# Altium schematic sheet Connectors.SchDoc
size B; SheetNumber: 3; SheetTotal: 8
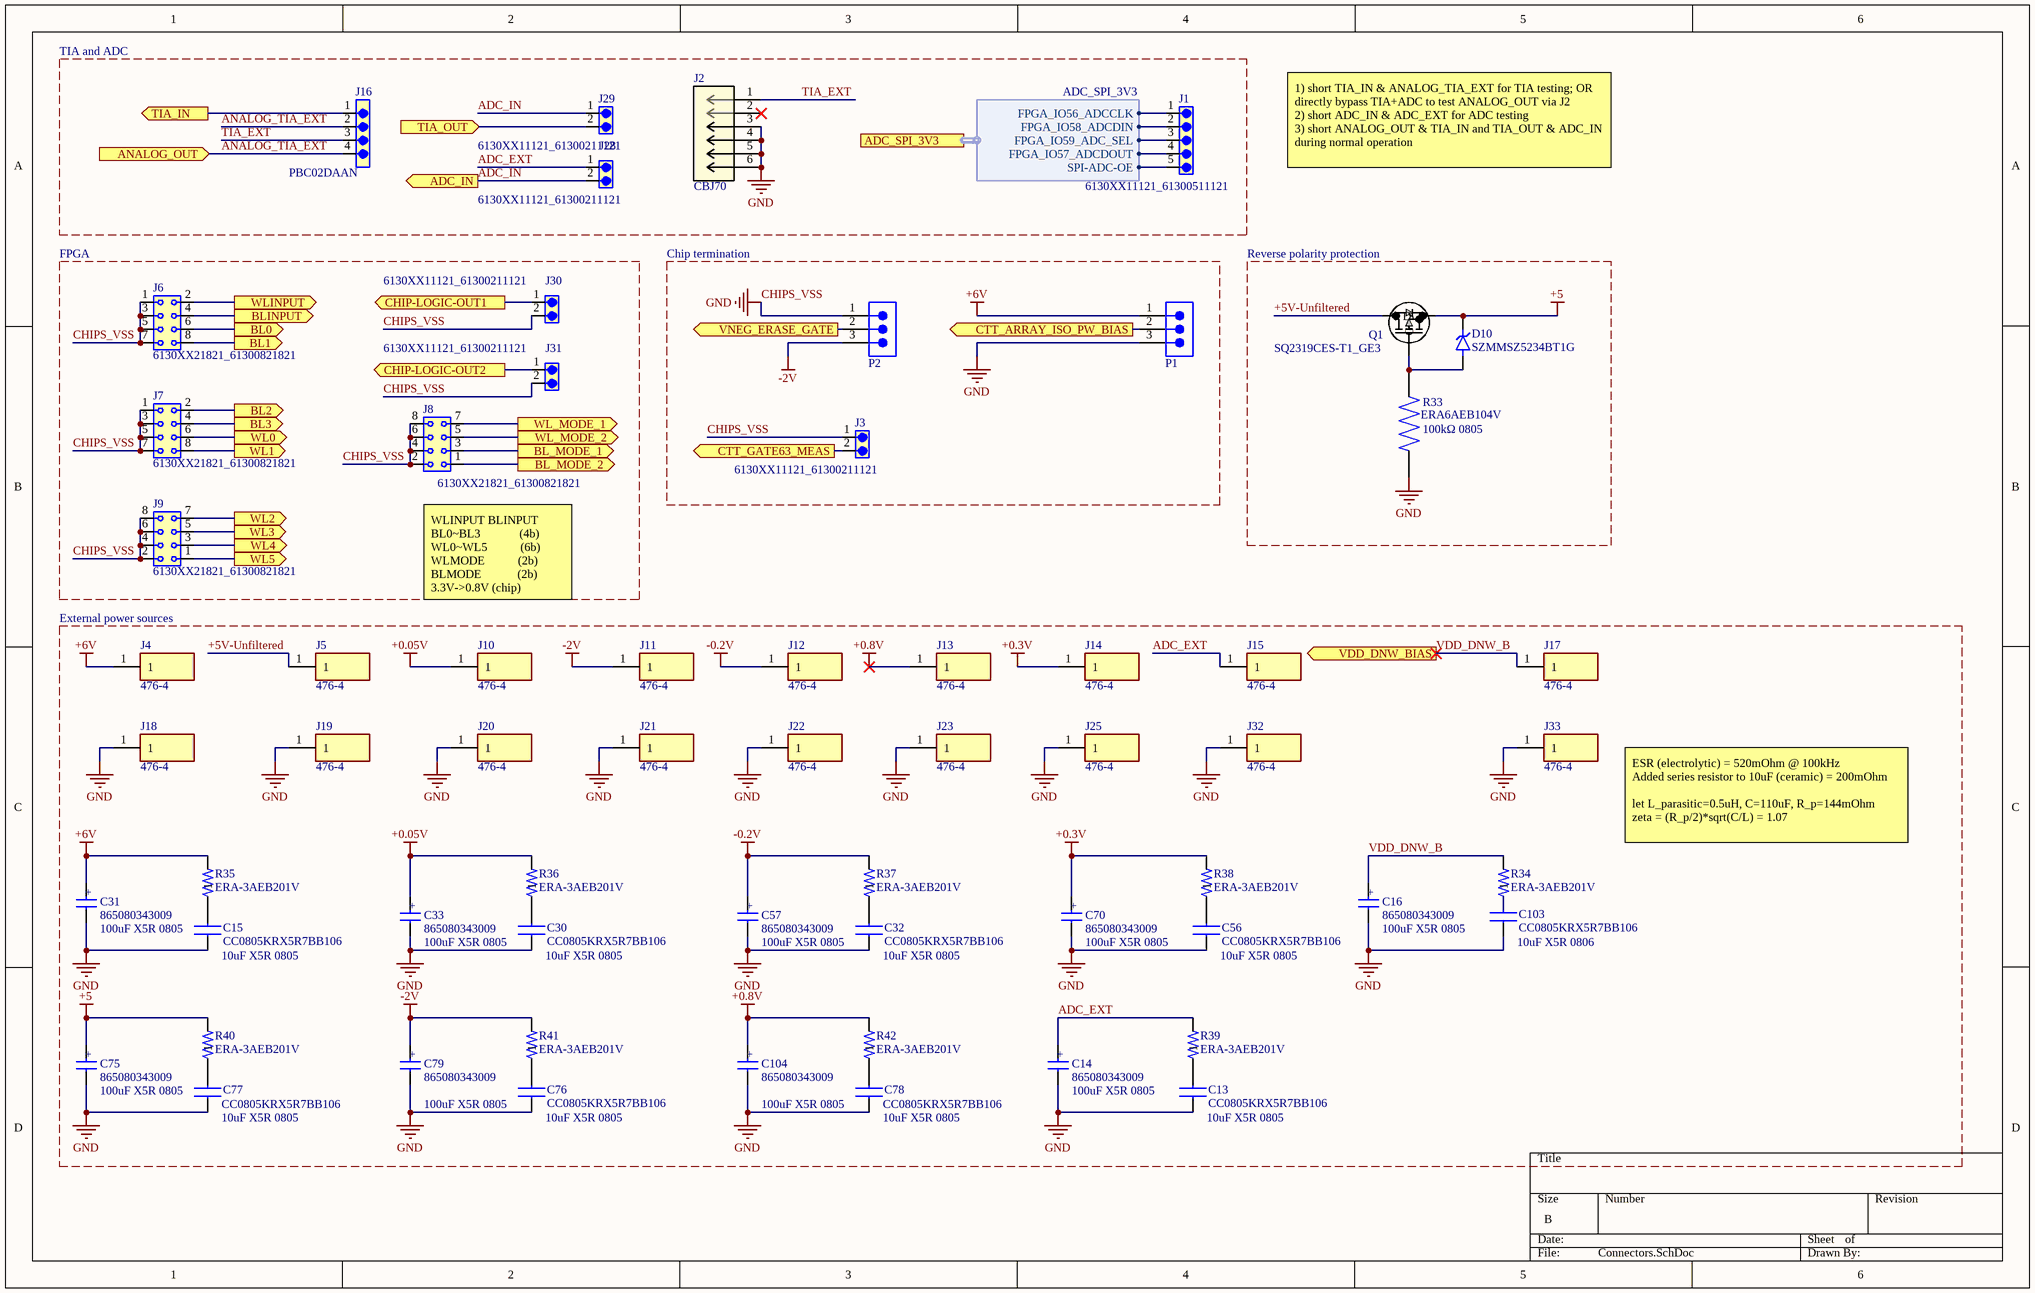
[diagram p0: Connectors.SchDoc]

## Parts
C13  CC0805KRX5R7BB106  [CAP_CC0805_YAG]
C14  865080343009  [WCAP-ASLI_6.3X5.5(DXL)]
C15  CC0805KRX5R7BB106  [CAP_CC0805_YAG]
C16  865080343009  [WCAP-ASLI_6.3X5.5(DXL)]
C30  CC0805KRX5R7BB106  [CAP_CC0805_YAG]
C31  865080343009  [WCAP-ASLI_6.3X5.5(DXL)]
C32  CC0805KRX5R7BB106  [CAP_CC0805_YAG]
C33  865080343009  [WCAP-ASLI_6.3X5.5(DXL)]
C56  CC0805KRX5R7BB106  [CAP_CC0805_YAG]
C57  865080343009  [WCAP-ASLI_6.3X5.5(DXL)]
C70  865080343009  [WCAP-ASLI_6.3X5.5(DXL)]
C75  865080343009  [WCAP-ASLI_6.3X5.5(DXL)]
C76  CC0805KRX5R7BB106  [CAP_CC0805_YAG]
C77  CC0805KRX5R7BB106  [CAP_CC0805_YAG]
C78  CC0805KRX5R7BB106  [CAP_CC0805_YAG]
C79  865080343009  [WCAP-ASLI_6.3X5.5(DXL)]
C103  CC0805KRX5R7BB106  [CAP_CC0805_YAG]
C104  865080343009  [WCAP-ASLI_6.3X5.5(DXL)]
D10  SZMMSZ5234BT1G  [DIO_SZMMSZ5234BT1G]
J1  6130XX11121_61300511121  [61300511121]
J2  CBJ70  [CONN_CBJ70_CIN]
J3  6130XX11121_61300211121  [61300211121]
J4  476-4  [4764]
J5  476-4  [4764]
J6  6130XX21821_61300821821  [61300821821]
J7  6130XX21821_61300821821  [61300821821]
J8  6130XX21821_61300821821  [61300821821]
J9  6130XX21821_61300821821  [61300821821]
J10  476-4  [4764]
J11  476-4  [4764]
J12  476-4  [4764]
J13  476-4  [4764]
J14  476-4  [4764]
J15  476-4  [4764]
J16  PBC02DAAN  [CONN4_DAAN_SUL]
J17  476-4  [4764]
J18  476-4  [4764]
J19  476-4  [4764]
J20  476-4  [4764]
J21  476-4  [4764]
J22  476-4  [4764]
J23  476-4  [4764]
J25  476-4  [4764]
J28  6130XX11121_61300211121  [61300211121]
J29  6130XX11121_61300211121  [61300211121]
J30  6130XX11121_61300211121  [61300211121]
J31  6130XX11121_61300211121  [61300211121]
J32  476-4  [4764]
J33  476-4  [4764]
P1  61300311121  [61300311121]  (value not drawn)
P2  61300311121  [61300311121]  (value not drawn)
Q1  SQ2319CES-T1_GE3  [PMOSGSD_SOT-23_TO-236_VIS]
R33  ERA6AEB104V  [RES_ERA6AEB104V]
R34  ERA-3AEB201V  [RES_ERA3AEB201V]
R35  ERA-3AEB201V  [RES_ERA3AEB201V]
R36  ERA-3AEB201V  [RES_ERA3AEB201V]
R37  ERA-3AEB201V  [RES_ERA3AEB201V]
R38  ERA-3AEB201V  [RES_ERA3AEB201V]
R39  ERA-3AEB201V  [RES_ERA3AEB201V]
R40  ERA-3AEB201V  [RES_ERA3AEB201V]
R41  ERA-3AEB201V  [RES_ERA3AEB201V]
R42  ERA-3AEB201V  [RES_ERA3AEB201V]

## Blocks framed on the sheet
TIA and ADC: J1 J2 J16 J28 J29
FPGA: J6-J9 J30 J31
Chip termination: J3 P1 P2

## Ports
ADC_IN (out), ADC_SPI_3V3 (harness ADC_SPI_3V3), ANALOG_OUT (in), BL0 (out), BL1 (out), BL2 (out), BL3 (out), BL_MODE_1 (out), BL_MODE_2 (out), BLINPUT (out), CHIP-LOGIC-OUT1 (out), CHIP-LOGIC-OUT2 (out), CTT_ARRAY_ISO_PW_BIAS (out), CTT_GATE63_MEAS (out), TIA_IN (out), TIA_OUT (in), VDD_DNW_BIAS (out), VNEG_ERASE_GATE (out), WL0 (out), WL1 (out), WL2 (out), WL3 (out), WL4 (out), WL5 (out), WL_MODE_1 (out), WL_MODE_2 (out), WLINPUT (out)

## Harnesses
ADC_SPI_3V3: FPGA_IO56_ADCCLK, FPGA_IO59_ADC_SEL, SPI-ADC-OE, FPGA_IO58_ADCDIN, FPGA_IO57_ADCDOUT

## Nets
+0.3V: C70.1(POS) J14.1 R38.2
+0.05V: C33.1(POS) J10.1 R36.2
+0.8V: C104.1(POS) J13.1 R42.2
+5: C75.1(POS) D10.1(K) Q1.2(S) R40.2
+6V: C31.1(POS) J4.1 P1.1 R35.2
-0.2V: C57.1(POS) J12.1 R37.2
-2V: C79.1(POS) J11.1 P2.3 R41.2
CHIPS_VSS: C13.1 C14.2(NEG) C15.1 C16.2(NEG) C30.1 C31.2(NEG) C32.1 C33.2(NEG) C56.1 C57.2(NEG) C70.2(NEG) C75.2(NEG) C76.1 C77.1 C78.1 C79.2(NEG) C103.1 C104.2(NEG) J2.3 J2.4 J2.5 J2.6 J3.1 J6.1 J6.3 J6.5 J6.7 J7.1 J7.3 J7.5 J7.7 J8.2 J8.4 J8.6 J8.8 J9.2 J9.4 J9.6 J9.8 J18.1 J19.1 J20.1 J21.1 J22.1 J23.1 J25.1 J30.2 J31.2 J32.1 J33.1 P1.3 P2.1 R33.1  [also labelled GND]
+5V-Unfiltered: J5.1 Q1.3(D)
ADC_EXT: C14.1(POS) J15.1 J28.1 R39.2
ADC_IN: J28.2 J29.1 ; port ADC_IN
ANALOG_TIA_EXT: J16.2 J16.4 ; port ANALOG_OUT
BL0: J6.6 ; port BL0
BL1: J6.8 ; port BL1
BL2: J7.2 ; port BL2
BL3: J7.4 ; port BL3
BL_MODE_1: J8.3 ; port BL_MODE_1
BL_MODE_2: J8.1 ; port BL_MODE_2
BLINPUT: J6.4 ; port BLINPUT
CHIP-LOGIC-OUT1: J30.1 ; port CHIP-LOGIC-OUT1
CHIP-LOGIC-OUT2: J31.1 ; port CHIP-LOGIC-OUT2
CTT_ARRAY_ISO_PW_BIAS: P1.2 ; port CTT_ARRAY_ISO_PW_BIAS
CTT_GATE63_MEAS: J3.2 ; port CTT_GATE63_MEAS
TIA_EXT: J2.1 J16.3
TIA_IN: J16.1 ; port TIA_IN
TIA_OUT: J29.2 ; port TIA_OUT
VDD_DNW_B: C16.1(POS) J17.1 R34.2 ; port VDD_DNW_BIAS
VNEG_ERASE_GATE: P2.2 ; port VNEG_ERASE_GATE
WL0: J7.6 ; port WL0
WL1: J7.8 ; port WL1
WL2: J9.7 ; port WL2
WL3: J9.5 ; port WL3
WL4: J9.3 ; port WL4
WL5: J9.1 ; port WL5
WL_MODE_1: J8.7 ; port WL_MODE_1
WL_MODE_2: J8.5 ; port WL_MODE_2
WLINPUT: J6.2 ; port WLINPUT
NetC13_2: C13.2 R39.1
NetC15_2: C15.2 R35.1
NetC30_2: C30.2 R36.1
NetC32_2: C32.2 R37.1
NetC56_2: C56.2 R38.1
NetC76_2: C76.2 R41.1
NetC77_2: C77.2 R40.1
NetC78_2: C78.2 R42.1
NetC103_2: C103.2 R34.1
NetD10_2: D10.2(A) Q1.1(G) R33.2
NetJ1_1: J1.1 ; port ADC_SPI_3V3.FPGA_IO56_ADCCLK
NetJ1_2: J1.2 ; port ADC_SPI_3V3.FPGA_IO58_ADCDIN
NetJ1_3: J1.3 ; port ADC_SPI_3V3.FPGA_IO59_ADC_SEL
NetJ1_4: J1.4 ; port ADC_SPI_3V3.FPGA_IO57_ADCDOUT
NetJ1_5: J1.5 ; port ADC_SPI_3V3.SPI-ADC-OE

Not connected (* = marked no-connect by the designer): J2 2*

## Notes on the sheet
- 1) short TIA_IN & ANALOG_TIA_EXT for TIA testing; OR directly bypass TIA+ADC to test ANALOG_OUT via J2
  2) short ADC_IN & ADC_EXT for ADC testing
  3) short ANALOG_OUT & TIA_IN and TIA_OUT & ADC_IN during normal operation
- Reverse polarity protection
- (near R33) 100kΩ 0805
- External power sources
- (near J8) WLINPUT BLINPUT
  BL0~BL3             (4b)
  WL0~WL5           (6b)
  WLMODE           (2b)
  BLMODE            (2b)
  3.3V->0.8V (chip)
- ESR (electrolytic) = 520mOhm @ 100kHz
  Added series resistor to 10uF (ceramic) = 200mOhm
  let L_parasitic=0.5uH, C=110uF, R_p=144mOhm
  zeta = (R_p/2)*sqrt(C/L) = 1.07
- 100uF X5R 0805
- (near C15) 10uF X5R 0805
- (near C30) 10uF X5R 0805
- (near C32) 10uF X5R 0805
- (near C70) 100uF X5R 0805
- (near C56) 10uF X5R 0805
- (near C16) 100uF X5R 0805
- (near C103) 10uF X5R 0806
- (near C14) 100uF X5R 0805
- (near C77) 10uF X5R 0805
- (near C76) 10uF X5R 0805
- (near C78) 10uF X5R 0805
- (near C13) 10uF X5R 0805
- (in symbol WCAP-ASLI_6.3X5.5) +

## Library data of the parts
C13 C15 C30 C32 C56 C76-C78 C103 = CC0805KRX5R7BB106: 10 µF ±10% 16V Ceramic Capacitor X5R 0805 (2012 Metric); Manufacturer_Name: Yageo; Copyright: Copyright (C) 2025 Ultra Librarian. All rights reserved.; Manufacturer_Part_Number: CC0805KRX5R7BB106
C14 C16 C31 C33 C57 C70 C75 C79 C104 = WCAP-ASLI_6.3X5.5: 100 µF 16 V Aluminum Electrolytic Capacitors Radial, Can - SMD 2000 Hrs @ 105°C; MF: {'manufacturer': u'W\xfcrth Elektronik'}; Package: None; Price: None; Value: *; MP: 865080343009; Availability: Unavailable
D10 = SZMMSZ5234BT1G: Zener Diode 6.2 V 500 mW ±5% Surface Mount SOD-123; MF: {'manufacturer': u'onsemi'}; Package: None; Price: None; Value: *; MP: SZMMSZ5234BT1G; Availability: Unavailable
J1 = 6130XX11121_61300511121: MF: {'manufacturer': u'W\xfcrth Elektronik'}; Package: None; Price: None; Value: *; MP: 61300511121; Availability: Unavailable
J2 = CBJ70: Description; Manufacturer_Name: Cinch Connectivity Solutions; Copyright: Copyright (C) 2025 Ultra Librarian. All rights reserved.; Manufacturer_Part_Number: CBJ70; RefDes: RefDes; Type: Type
J3 J28-J31 = 6130XX11121_61300211121: MF: {'manufacturer': u'Wurth Electronics'}; Package: None; Price: None; Value: *; MP: 61300211121; Availability: Unavailable; ComponentLink1Description: Digikey link; ComponentLink1URL: https://www.digikey.com/en/products/detail/w%C3%BCrth-elektronik/61300211121/4846823
J4 J5 J10-J15 J17-J23 J25 J32 J33 = 476-4: Banana Jack Connector Miniature Solder; Manufacturer_Name: Keystone Electronics; Geometry.Height: 6.66mm; Mouser Part Number: 534-476-4; Mouser Price/Stock: https://www.mouser.co.uk/ProductDetail/Keystone-Electronics/476-4?qs=w4ABFRoM%2FL8IE7UmBO5PGw%3D%3D; Manufacturer_Part_Number: 476-4; Datasheet Link: https://www.digikey.com/en/products/detail/keystone-electronics/476-4/318477
J6-J9 = 6130XX21821_61300821821: WR-PHD 2.54 MM DUAL SOCKET HEADE; MF: WÃ¼rth Elektronik; SnapEDA_Link: https://www.snapeda.com/parts/61300821821/W%25C3%25BCrth+Elektronik+Midcom/view-part/?ref=snap; Package: None; Value: *; MP: 61300821821; Check_prices: https://www.snapeda.com/parts/61300821821/W%25C3%25BCrth+Elektronik+Midcom/view-part/?ref=eda
J16 = PBC02DAAN: Connector Header Through Hole 4 position 0.100" (2.54mm); Manufacturer_Name: Sullins; Copyright: Copyright (C) 2026 Ultra Librarian. All rights reserved.; Manufacturer_Part_Number: PBC02DAAN; RefDes: RefDes; Type: Type
P1 P2 = 61300311121: WR-PHD Pin Header, THT, Vertical, pitch 2.54mm, 1 Row, 3P; Manufacturer: Wurth Elektronik; Contact Resistance: 20mOhm; Rated Current: 3A; Working Voltage: 250V; Withstanding Voltage: 500V; Manufacturer Part Number: 61300311121; Category: Board-to-Board Connectors; Match Code: WR-PHD; ComponentLink1Description: Website Link; ComponentLink1URL: https://www.we-online.com/redexpert/article/61300311121?ad; ComponentLink2Description: Datasheet Link; ComponentLink2URL: https://www.we-online.com/redexpert/spec/61300311121?ad; Mount: Through Hole; Operating Temperature Max: 105°C; Operating Temperature Min: -40°C; Packaging: Bag; Gender: Pin Header; Number of Pins: 3; Number of Rows: 1; Orientation: Vertical; Pitch: 2.54mm
Q1 = SQ2319CES-T1_GE3: P-CHANNEL 40-V (D-S) MOSFET; Manufacturer_Name: Vishay; Copyright: Copyright (C) 2025 Ultra Librarian. All rights reserved.; Manufacturer_Part_Number: SQ2319CES-T1_GE3
R33 = ERA6AEB104V: 100 kOhms ±0.1% 0.125W, 1/8W Chip Resistor 0805 (2012 Metric) Automotive AEC-Q200 Thin Film; Price: None; Value: *; Availability: Unavailable; MP: ERA6AEB104V; Package: None
R34-R42 = ERA3AEB201V: 200 Ohms ±0.1% 0.1W, 1/10W Chip Resistor 0603 (1608 Metric) Automotive AEC-Q200 Thin Film; Package: None; Availability: Unavailable; Price: None; MP: ERA3AEB201V; Value: *